# Altium schematic sheet ECG AFE.SchDoc: ECG AFE
size A4; DocumentNumber: 7; SheetNumber: 7; SheetTotal: 9
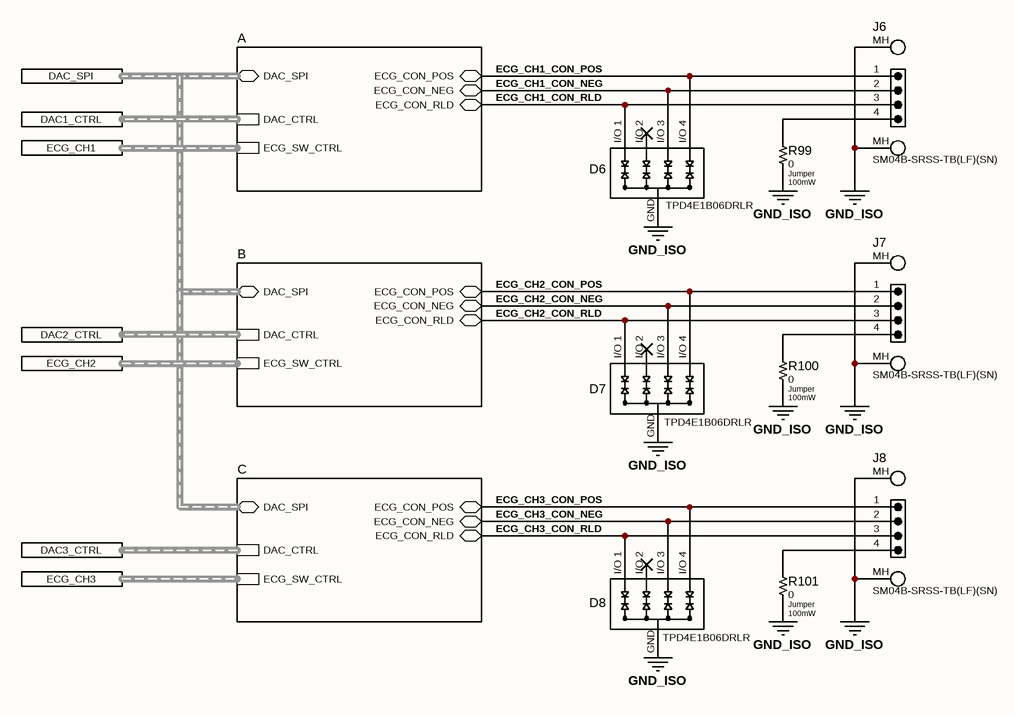
[diagram p0: ECG AFE.SchDoc]

## Parts
D6  TPD4E1B06DRLR  [FP-DRL0006A-MFG]
D7  TPD4E1B06DRLR  [FP-DRL0006A-MFG]
D8  TPD4E1B06DRLR  [FP-DRL0006A-MFG]
J6  SM04B-SRSS-TB(LF)(SN)  [SM04B-SRSS-TB(LF)(SN)]
J7  SM04B-SRSS-TB(LF)(SN)  [SM04B-SRSS-TB(LF)(SN)]
J8  SM04B-SRSS-TB(LF)(SN)  [SM04B-SRSS-TB(LF)(SN)]
R99  0  Tolerance: Jumper  Power: 100mW  [RES-0402-N]
R100  0  Tolerance: Jumper  Power: 100mW  [RES-0402-N]
R101  0  Tolerance: Jumper  Power: 100mW  [RES-0402-N]

## Sub-sheets
A = AFE Channel.SchDoc: DAC_SPI (bidir, harness DAC_SPI), DAC_CTRL (harness DAC_CTRL), ECG_SW_CTRL (harness ECG_SW_CTRL), ECG_CON_POS (bidir), ECG_CON_NEG (bidir), ECG_CON_RLD (bidir)
B = AFE Channel.SchDoc: DAC_SPI (bidir, harness DAC_SPI), DAC_CTRL (harness DAC_CTRL), ECG_SW_CTRL (harness ECG_SW_CTRL), ECG_CON_POS (bidir), ECG_CON_NEG (bidir), ECG_CON_RLD (bidir)
C = AFE Channel.SchDoc: DAC_SPI (bidir, harness DAC_SPI), DAC_CTRL (harness DAC_CTRL), ECG_SW_CTRL (harness ECG_SW_CTRL), ECG_CON_POS (bidir), ECG_CON_NEG (bidir), ECG_CON_RLD (bidir)

## Ports
DAC1_CTRL (harness DAC1_CTRL), DAC2_CTRL (harness DAC1_CTRL), DAC3_CTRL (harness DAC1_CTRL), DAC_SPI (harness DAC_SPI), ECG_CH1 (harness ECG_CH1), ECG_CH2 (harness ECG_CH2), ECG_CH3 (harness ECG_CH3)

## Nets
GND_ISO: D6.2(GND) D7.2(GND) D8.2(GND) J6.MH1(MH) J6.MH2(MH) J7.MH1(MH) J7.MH2(MH) J8.MH1(MH) J8.MH2(MH) R99.2 R100.2 R101.2
ECG_CH1_CON_NEG: D6.4(I/O_3) J6.2 ; sheet A/ECG_CON_NEG
ECG_CH1_CON_POS: D6.6(I/O_4) J6.1 ; sheet A/ECG_CON_POS
ECG_CH1_CON_RLD: D6.1(I/O_1) J6.3 ; sheet A/ECG_CON_RLD
ECG_CH2_CON_NEG: D7.4(I/O_3) J7.2 ; sheet B/ECG_CON_NEG
ECG_CH2_CON_POS: D7.6(I/O_4) J7.1 ; sheet B/ECG_CON_POS
ECG_CH2_CON_RLD: D7.1(I/O_1) J7.3 ; sheet B/ECG_CON_RLD
ECG_CH3_CON_NEG: D8.4(I/O_3) J8.2 ; sheet C/ECG_CON_NEG
ECG_CH3_CON_POS: D8.6(I/O_4) J8.1 ; sheet C/ECG_CON_POS
ECG_CH3_CON_RLD: D8.1(I/O_1) J8.3 ; sheet C/ECG_CON_RLD
NetJ6_4: J6.4 R99.1
NetJ7_4: J7.4 R100.1
NetJ8_4: J8.4 R101.1

Not connected (* = marked no-connect by the designer): D6 3(I/O_2)*; D7 3(I/O_2)*; D8 3(I/O_2)*

## Buses and harness runs
harness port DAC1_CTRL = sheet A/DAC_CTRL
harness port DAC2_CTRL = sheet B/DAC_CTRL
harness port DAC3_CTRL = sheet C/DAC_CTRL
harness port DAC_SPI = sheet A/DAC_SPI = sheet B/DAC_SPI = sheet C/DAC_SPI
harness port ECG_CH1 = sheet A/ECG_SW_CTRL
harness port ECG_CH2 = sheet B/ECG_SW_CTRL
harness port ECG_CH3 = sheet C/ECG_SW_CTRL

## Notes on the sheet
- COMMERCIAL IN CONFIDENCE
- CLIENT
- THIS DOCUMENT IS UNCONTROLLED WHEN PRINTED
- PROJECT
- PART NAME
- TITLE
- SHEET SIZE
- SHEET
- DATE
- A4
- FILE
- PROJECT CODE
- PART / DWG No.
- REV
- VARIANT
- AUTHOR

## Library data of the parts
D6-D8 = CMP-0000003522-1: DIODE-ESD-5.5V-TPD4E1B06DRLR; Manufacturer: Texas Instruments; Voltage - Reverse: 5.5V; Type: ESD Diode Array; Current: N/A; Manufacturer Part Number: TPD4E1B06DRLR; ComponentLink1Description: Datasheet; ComponentLink1URL: https://www.ti.com/general/docs/suppproductinfo.tsp?distId=10&gotoUrl=https%3A%2F%2Fwww.ti.com%2Flit%2Fgpn%2Ftpd4e1b06
J6-J8 = CMP-0000003475-5: CONN-JST-SR/SZ-1x4-SM04B-SRSS-TB(LF)(SN); pin to pad: MH1>5 MH2>6; Manufacturer: JST; ComponentLink1URL: https://au.mouser.com/datasheet/3/1070/1/eSR_SZ.pdf; Manufacturer Part Number: SM04B-SRSS-TB(LF)(SN); Type: Header; ComponentLink1Description: Datasheet
R99-R101 = CMP-0000000811-2: RES-0-0402-JUMPER-100mW; Value: 0